# Altium schematic sheet slots.SchDoc
size A4
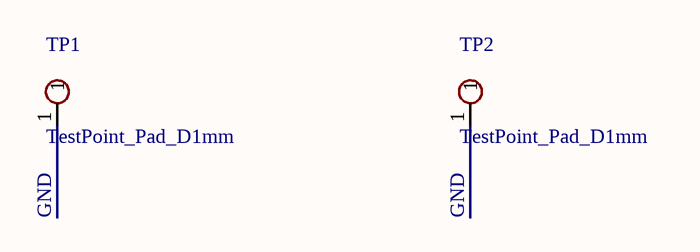
[diagram p0: slots.SchDoc]

## Parts
TP1  TestPoint_Pad_D1mm  [TestPoint_Pad_D1mm]
TP2  TestPoint_Pad_D1mm  [TestPoint_Pad_D1mm]

## Nets
GND: TP1.1 TP2.1

## Library data of the parts
TP1 TP2 = TestPoint